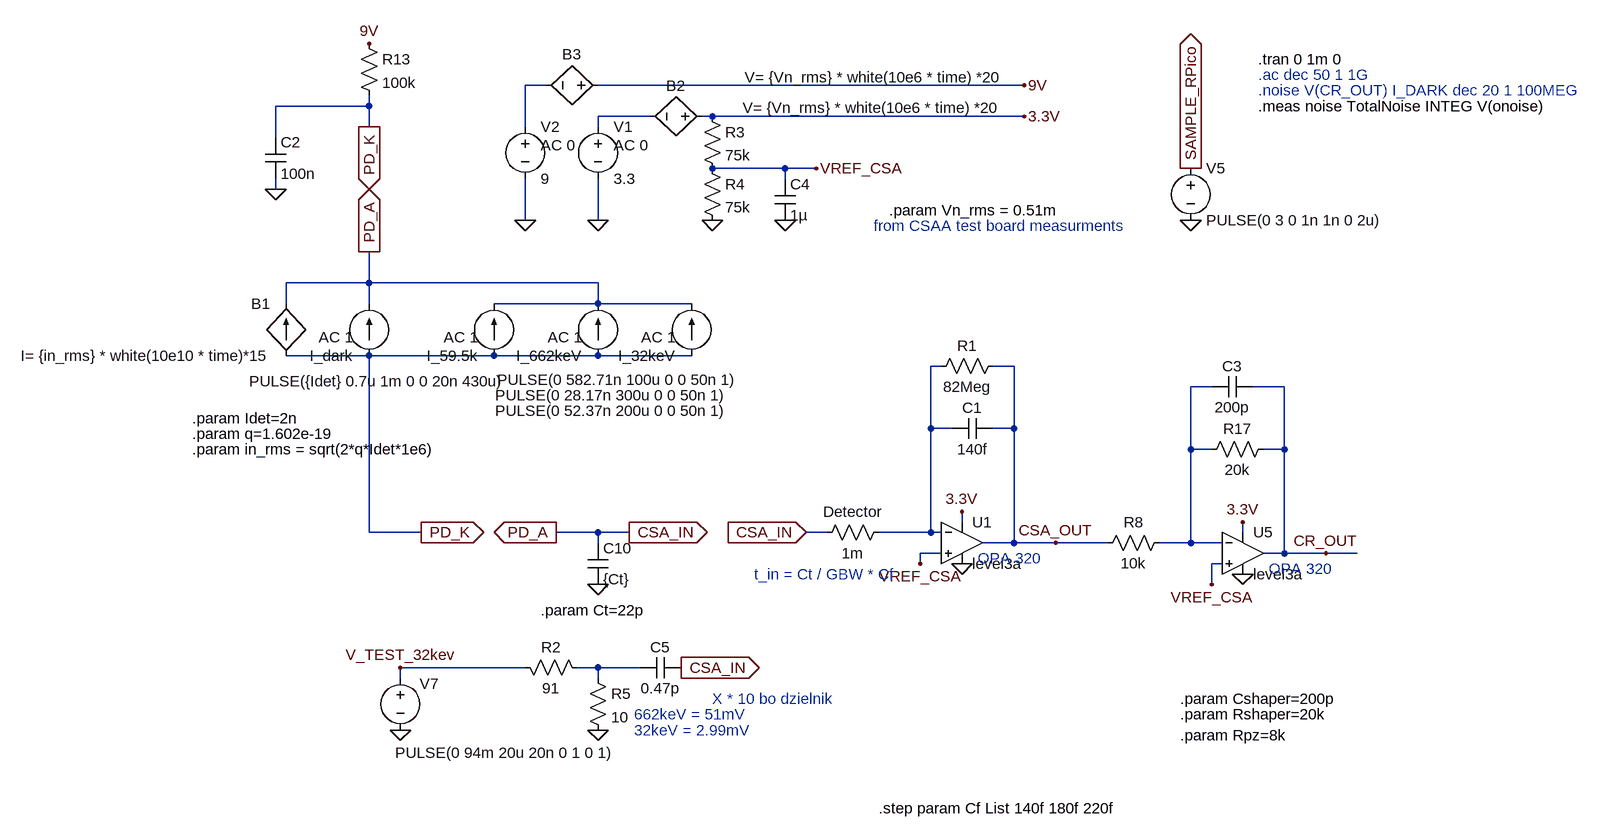
[diagram p0: schematic analog-front-end-minimal.asc]
analog-front-end-minimal.asc, the LTspice schematic file:
Version 4
SHEET 1 2964 1200
WIRE -1264 -560 -1296 -560
WIRE -528 -560 -1184 -560
WIRE -1536 -528 -1536 -544
WIRE -1536 -528 -1680 -528
WIRE -1104 -512 -1184 -512
WIRE -1008 -512 -1024 -512
WIRE -528 -512 -1008 -512
WIRE -1536 -496 -1536 -528
WIRE -1296 -496 -1296 -560
WIRE -1184 -496 -1184 -512
WIRE -1680 -480 -1680 -528
WIRE -896 -432 -1008 -432
WIRE -848 -432 -896 -432
WIRE -896 -416 -896 -432
WIRE -1680 -400 -1680 -416
WIRE -1296 -352 -1296 -416
WIRE -1184 -352 -1184 -416
WIRE -1536 -256 -1536 -304
WIRE -1536 -256 -1664 -256
WIRE -1184 -256 -1536 -256
WIRE -1664 -224 -1664 -256
WIRE -1536 -224 -1536 -256
WIRE -1184 -224 -1184 -256
WIRE -1184 -224 -1344 -224
WIRE -1040 -224 -1184 -224
WIRE -1536 -144 -1664 -144
WIRE -1344 -144 -1536 -144
WIRE -1184 -144 -1344 -144
WIRE -1040 -144 -1184 -144
WIRE -656 -128 -672 -128
WIRE -544 -128 -576 -128
WIRE -240 -96 -272 -96
WIRE -128 -96 -176 -96
WIRE -672 -32 -672 -128
WIRE -640 -32 -672 -32
WIRE -544 -32 -544 -128
WIRE -544 -32 -576 -32
WIRE -272 0 -272 -96
WIRE -240 0 -272 0
WIRE -128 0 -128 -96
WIRE -128 0 -160 0
WIRE -624 112 -624 96
WIRE -1536 128 -1536 -144
WIRE -1456 128 -1536 128
WIRE -1184 128 -1248 128
WIRE -1136 128 -1184 128
WIRE -832 128 -864 128
WIRE -672 128 -672 -32
WIRE -672 128 -752 128
WIRE -656 128 -672 128
WIRE -192 128 -192 112
WIRE -1184 144 -1184 128
WIRE -544 144 -544 -32
WIRE -544 144 -592 144
WIRE -480 144 -544 144
WIRE -400 144 -480 144
WIRE -272 144 -272 0
WIRE -272 144 -320 144
WIRE -224 144 -272 144
WIRE -656 160 -688 160
WIRE -128 160 -128 0
WIRE -128 160 -160 160
WIRE -64 160 -128 160
WIRE -16 160 -64 160
WIRE -688 176 -688 160
WIRE -224 176 -240 176
WIRE -1184 208 -1184 192
WIRE -240 208 -240 176
WIRE -1296 336 -1488 336
WIRE -1184 336 -1216 336
WIRE -1120 336 -1184 336
WIRE -1488 352 -1488 336
WIRE -1184 352 -1184 336
FLAG -624 96 3.3V
FLAG -624 176 0
FLAG -1184 -352 0
FLAG -1008 -352 0
FLAG -864 128 CSA_IN
IOPIN -864 128 In
FLAG -896 -352 0
FLAG -528 -512 3.3V
FLAG -272 -432 SAMPLE_RPico
IOPIN -272 -432 Out
FLAG -1184 208 0
FLAG -1136 128 CSA_IN
IOPIN -1136 128 Out
FLAG -192 112 3.3V
FLAG -192 192 0
FLAG -1488 432 0
FLAG -1056 336 CSA_IN
IOPIN -1056 336 Out
FLAG -848 -432 VREF_CSA
FLAG -272 -352 0
FLAG -1184 432 0
FLAG -240 208 VREF_CSA
FLAG -688 176 VREF_CSA
FLAG -1536 -304 PD_A
IOPIN -1536 -304 Out
FLAG -1456 128 PD_K
IOPIN -1456 128 Out
FLAG -1296 -352 0
FLAG -528 -560 9V
FLAG -1248 128 PD_A
IOPIN -1248 128 Out
FLAG -1536 -496 PD_K
IOPIN -1536 -496 Out
FLAG -1536 -624 9V
FLAG -480 144 CSA_OUT
FLAG -1488 336 V_TEST_32kev
FLAG -64 160 CR_OUT
FLAG -1680 -400 0
SYMBOL voltage -1184 -512 R0
WINDOW 123 24 44 Left 2
WINDOW 39 0 0 Left 0
SYMATTR Value2 AC 0
SYMATTR InstName V1
SYMATTR Value 3.3
SYMBOL cap -576 -48 R90
WINDOW 0 0 32 VBottom 2
WINDOW 3 32 32 VTop 2
SYMATTR InstName C1
SYMATTR Value 140f
SYMBOL res -1024 -528 R0
SYMATTR InstName R3
SYMATTR Value 75k
SYMBOL res -1024 -448 R0
SYMATTR InstName R4
SYMATTR Value 75k
SYMBOL res -560 -144 R90
WINDOW 0 0 56 VBottom 2
WINDOW 3 32 56 VTop 2
SYMATTR InstName R1
SYMATTR Value 82Meg
SYMBOL OpAmps\\UniversalOpAmp3 -624 144 R0
SYMATTR InstName U1
SYMATTR Value2 Avol=0.6MEG GBW=20Meg Slew=10Meg
SYMATTR SpiceLine Ilimit=100m Rail=20m Vos=0 Phimargin=45
SYMATTR SpiceLine2 En=7n Enk=1k In=0.6f Ink=0 Rin=500Meg
SYMBOL cap -912 -416 R0
SYMATTR InstName C4
SYMATTR Value 1µ
SYMBOL voltage -272 -448 R0
WINDOW 123 0 0 Left 0
WINDOW 39 0 0 Left 0
SYMATTR InstName V5
SYMATTR Value PULSE(0 3 0 1n 1n 0 2u)
SYMBOL current -1040 -144 R180
WINDOW 3 -56 -61 Left 2
WINDOW 123 24 28 Left 2
WINDOW 39 0 0 Left 0
SYMATTR Value PULSE(0 28.17n 300u 0 0 50n 1)
SYMATTR Value2 AC 1
SYMATTR InstName I_32keV
SYMBOL cap -1200 144 R0
SYMATTR InstName C10
SYMATTR Value {Ct}
SYMBOL current -1536 -144 R180
WINDOW 3 -210 -39 Left 2
WINDOW 123 24 28 Left 2
WINDOW 39 0 0 Left 0
SYMATTR Value PULSE({Idet} 0.7u 1m 0 0 20n 430u)
SYMATTR Value2 AC 1
SYMATTR InstName I_dark
SYMBOL res -144 -16 R90
WINDOW 0 0 56 VBottom 2
WINDOW 3 32 56 VTop 2
SYMATTR InstName R17
SYMATTR Value 20k
SYMBOL res -304 128 R90
WINDOW 0 0 56 VBottom 2
WINDOW 3 32 56 VTop 2
SYMATTR InstName R8
SYMATTR Value 10k
SYMBOL res -736 112 R90
WINDOW 0 0 56 VBottom 2
WINDOW 3 32 56 VTop 2
SYMATTR InstName Detector
SYMATTR Value 1m
SYMBOL current -1184 -144 R180
WINDOW 3 -216 -37 Left 2
WINDOW 123 24 28 Left 2
WINDOW 39 0 0 Left 0
SYMATTR Value PULSE(0 582.71n 100u 0 0 50n 1)
SYMATTR Value2 AC 1
SYMATTR InstName I_662keV
SYMBOL cap -1056 320 R90
WINDOW 0 0 32 VBottom 2
WINDOW 3 32 32 VTop 2
SYMATTR InstName C5
SYMATTR Value 0.47p
SYMBOL voltage -1488 336 R0
WINDOW 0 30 25 Left 2
WINDOW 3 -8 131 Left 2
WINDOW 123 0 0 Left 0
WINDOW 39 0 0 Left 0
SYMATTR InstName V7
SYMATTR Value PULSE(0 94m 20u 20n 0 1 0 1)
SYMBOL bi -1664 -144 R180
WINDOW 3 24 0 Left 2
WINDOW 0 24 80 Left 2
SYMATTR Value I= {in_rms} * white(10e10 * time)*15
SYMATTR InstName B1
SYMBOL cap -176 -112 R90
WINDOW 0 0 32 VBottom 2
WINDOW 3 32 32 VTop 2
SYMATTR InstName C3
SYMATTR Value 200p
SYMBOL current -1344 -144 R180
WINDOW 3 -360 -85 Left 2
WINDOW 123 24 28 Left 2
WINDOW 39 0 0 Left 0
SYMATTR Value PULSE(0 52.37n 200u 0 0 50n 1)
SYMATTR Value2 AC 1
SYMATTR InstName I_59.5k
SYMBOL res -1312 320 M90
WINDOW 0 0 56 VBottom 2
WINDOW 3 32 56 VTop 2
SYMATTR InstName R2
SYMATTR Value 91
SYMBOL res -1200 336 R0
SYMATTR InstName R5
SYMATTR Value 10
SYMBOL res -1552 -640 R0
SYMATTR InstName R13
SYMATTR Value 100k
SYMBOL voltage -1296 -512 R0
WINDOW 123 24 44 Left 2
WINDOW 39 0 0 Left 0
SYMATTR Value2 AC 0
SYMATTR InstName V2
SYMATTR Value 9
SYMBOL bv -1008 -512 R90
WINDOW 0 -32 56 VBottom 2
WINDOW 3 -29 -245 VTop 2
SYMATTR InstName B2
SYMATTR Value V= {Vn_rms} * white(10e6 * time) *20
SYMBOL bv -1168 -560 R90
WINDOW 0 -32 56 VBottom 2
WINDOW 3 -28 -408 VTop 2
SYMATTR InstName B3
SYMATTR Value V= {Vn_rms} * white(10e6 * time) *20
SYMBOL OpAmps\\UniversalOpAmp3 -192 160 R0
SYMATTR InstName U5
SYMATTR Value2 Avol=0.6MEG GBW=20Meg Slew=10Meg
SYMATTR SpiceLine Ilimit=100m Rail=20m Vos=0 Phimargin=45
SYMATTR SpiceLine2 En=7n Enk=1k In=0.6f Ink=0 Rin=500Meg
SYMBOL cap -1696 -480 R0
SYMATTR InstName C2
SYMATTR Value 100n
TEXT -168 -600 Left 2 !.tran 0 1m 0
TEXT -600 168 Left 2 ;OPA 320
TEXT -944 192 Left 2 ;t_in = Ct / GBW * Cf
TEXT -288 384 Left 2 !.param Cshaper=200p
TEXT -288 408 Left 2 !.param Rshaper=20k
TEXT -168 -576 Left 2 ;.ac dec 50 1 1G
TEXT -288 440 Left 2 !.param Rpz=8k
TEXT -1128 408 Left 2 ;662keV = 51mV
TEXT -1128 432 Left 2 ;32keV = 2.99mV
TEXT -1808 -48 Left 2 !.param Idet=2n
TEXT -1808 -24 Left 2 !.param q=1.602e-19
TEXT -1808 0 Left 2 !.param in_rms = sqrt(2*q*Idet*1e6)
TEXT -1272 248 Left 2 !.param Ct=22p
TEXT -736 -368 Left 2 !.param Vn_rms = 0.51m
TEXT -168 -552 Left 2 ;.noise V(CR_OUT) I_DARK dec 20 1 100MEG
TEXT -168 -528 Left 2 !.meas noise TotalNoise INTEG V(onoise)
TEXT -152 184 Left 2 ;OPA 320
TEXT -760 -344 Left 2 ;from CSAA test board measurments
TEXT -1008 384 Left 2 ;X * 10 bo dzielnik
TEXT -752 552 Left 2 !.step param Cf List 140f 180f 220f

The netlist it stands for:
* analog-front-end-minimal.asc
V1 N002 0 3.3 AC 0
C1 CSA_OUT N003 140f
R3 3.3V VREF_CSA 75k
R4 VREF_CSA 0 75k
R1 CSA_OUT N003 82Meg
XU1 VREF_CSA N003 3.3V 0 CSA_OUT level3a Avol=0.6MEG GBW=20Meg Slew=10Meg Ilimit=100m Rail=20m Vos=0 Phimargin=45 En=7n Enk=1k In=0.6f Ink=0 Rin=500Meg  ; pins In+ In- V+ V- OUT
C4 VREF_CSA 0 1µ
V5 SAMPLE_RPico 0 PULSE(0 3 0 1n 1n 0 2u)
I_32keV PD_K PD_A PULSE(0 28.17n 300u 0 0 50n 1) AC 1
C10 PD_A 0 {Ct}
I_dark PD_K PD_A PULSE({Idet} 0.7u 1m 0 0 20n 430u) AC 1
R17 CR_OUT N004 20k
R8 N004 CSA_OUT 10k
R§Detector N003 PD_A 1m
I_662keV PD_K PD_A PULSE(0 582.71n 100u 0 0 50n 1) AC 1
C5 PD_A N005 0.47p
V7 V_TEST_32kev 0 PULSE(0 94m 20u 20n 0 1 0 1)
B1 PD_K PD_A I= {in_rms} * white(10e10 * time)*15
C3 CR_OUT N004 200p
I_59.5k PD_K PD_A PULSE(0 52.37n 200u 0 0 50n 1) AC 1
R2 V_TEST_32kev N005 91
R5 N005 0 10
R13 9V PD_K 100k
V2 N001 0 9 AC 0
B2 3.3V N002 V= {Vn_rms} * white(10e6 * time) *20
B3 9V N001 V= {Vn_rms} * white(10e6 * time) *20
XU5 VREF_CSA N004 3.3V 0 CR_OUT level3a Avol=0.6MEG GBW=20Meg Slew=10Meg Ilimit=100m Rail=20m Vos=0 Phimargin=45 En=7n Enk=1k In=0.6f Ink=0 Rin=500Meg  ; pins In+ In- V+ V- OUT
C2 PD_K 0 100n
.tran 0 1m 0
* OPA 320
* t_in = Ct / GBW * Cf
.param Cshaper=200p
.param Rshaper=20k
* .ac dec 50 1 1G
.param Rpz=8k
* 662keV = 51mV
* 32keV = 2.99mV
.param Idet=2n
.param q=1.602e-19
.param in_rms = sqrt(2*q*Idet*1e6)
.param Ct=22p
.param Vn_rms = 0.51m
* .noise V(CR_OUT) I_DARK dec 20 1 100MEG
.meas noise TotalNoise INTEG V(onoise)
* OPA 320
* from CSAA test board measurments
* X * 10 bo dzielnik
.step param Cf List 140f 180f 220f
.backanno
.end